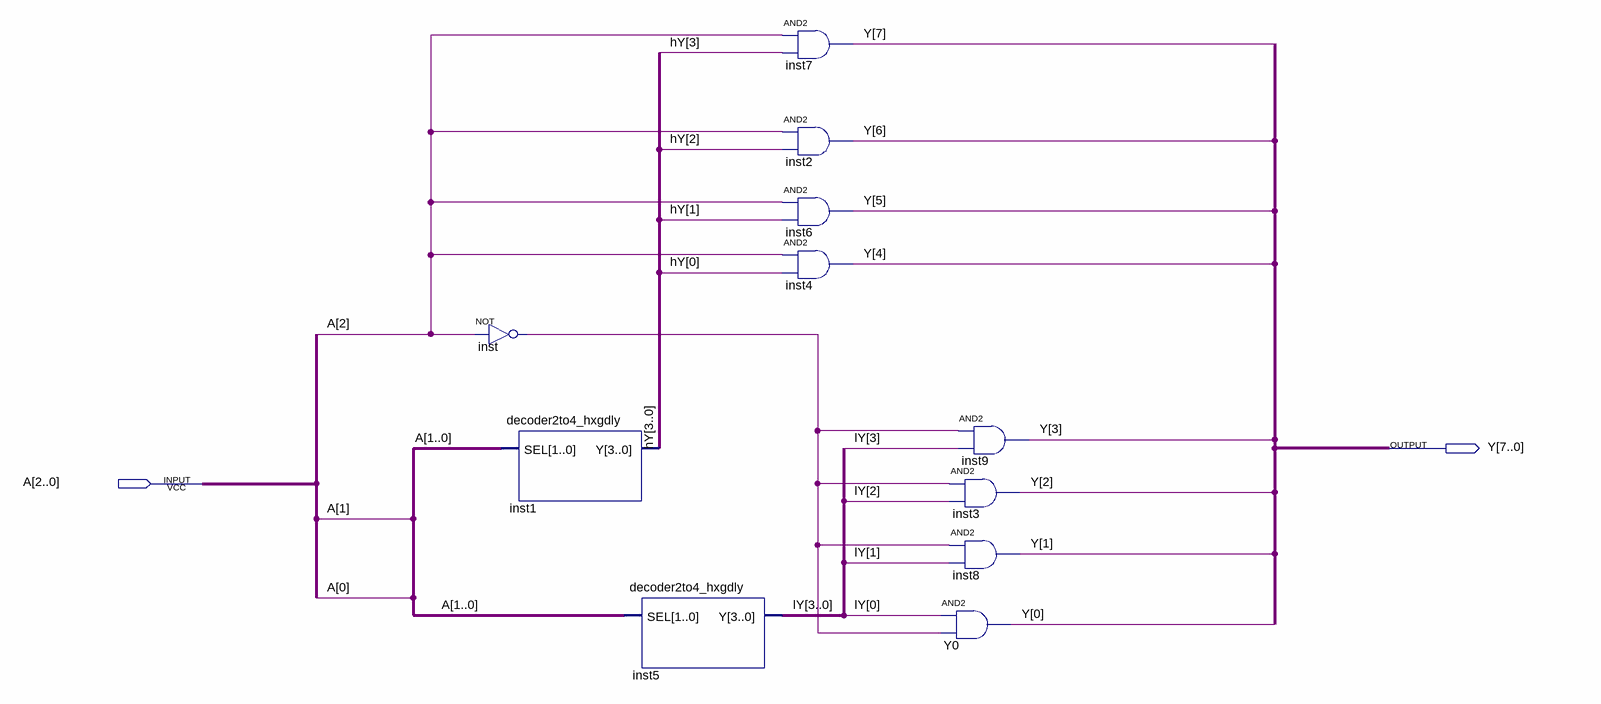
[diagram p0: schematic sheet]
// Quartus schematic decoder3to8_hxg.bdf as structural Verilog: 11 symbols, 2 pins
module decoder3to8_hxg (
  input  [2:0] A,
  output [7:0] Y
);

  wire inst_out;
  wire [3:0] hY, lY;

  not inst (inst_out, A[2]);
  decoder2to4_hxgdly inst1 (.SEL(A[1:0]), .Y(hY));
  decoder2to4_hxgdly inst5 (.SEL(A[1:0]), .Y(lY));
  and inst7 (Y[7], A[2], hY[3]);
  and inst2 (Y[6], A[2], hY[2]);
  and inst6 (Y[5], A[2], hY[1]);
  and inst4 (Y[4], A[2], hY[0]);
  and inst3 (Y[2], inst_out, lY[2]);
  and inst8 (Y[1], inst_out, lY[1]);
  and Y0 (Y[0], lY[0], inst_out);
  and inst9 (Y[3], inst_out, lY[3]);
endmodule
